# Altium schematic sheet 400_DC-DC_Part3.SchDoc: *DC-DC Convertion stage
size A4; Date: xxxxxx; DrawnBy: J.A.Oviedo; Revision: R1V1; SheetNumber: 5; SheetTotal: 5
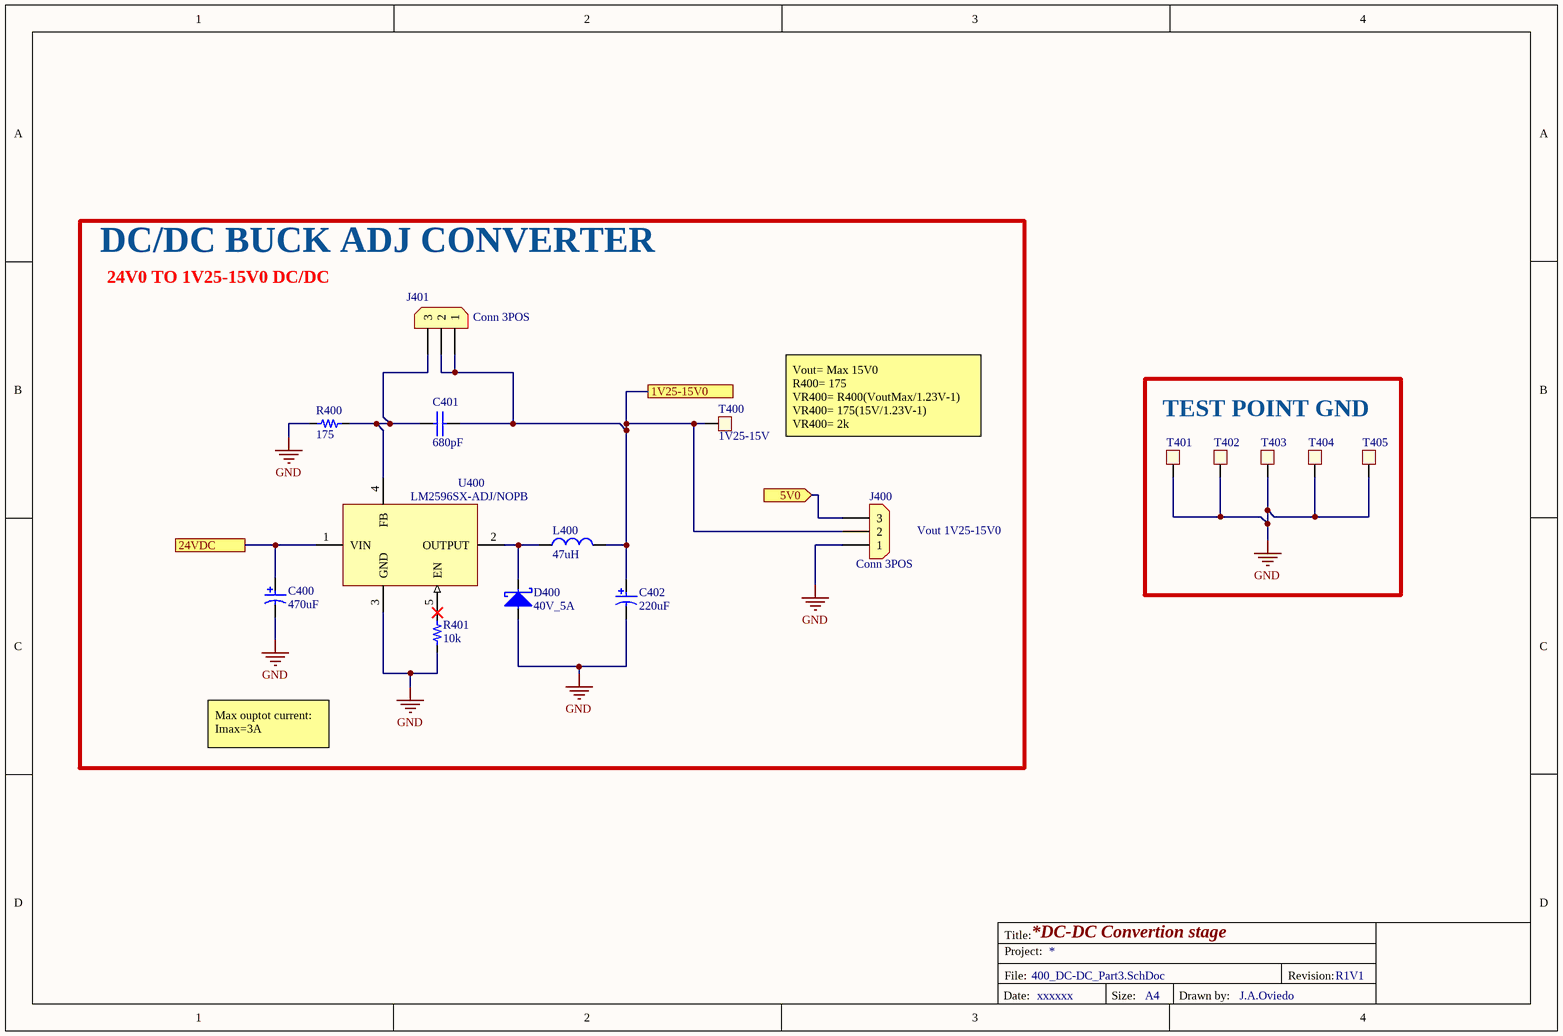
[diagram p0: 400_DC-DC_Part3.SchDoc]

## Parts
C400  value 470uF  [SMD_16*16*16]  (hidden comment: 470uF_50V)
C401  value 680pF  [0603]  (hidden comment: 680pF 50V)
C402  value 220uF  [RADIAL-CAN-SMD_Diax8mm_Hx10.2mm]  (hidden comment: 100uF 20%)
D400  40V_5A  [D_40V_5A_DO-214AC_Schottky]
J400  Conn 3POS  [CON_3x1_TH_5mm]
J401  Conn 3POS  [CON_3x1_TH_5mm]
L400  value 47uH  [L_47uH_5A_SMD_17.15x17]  (hidden comment: 47uH_5A)
R400  value 175  [Res_175_SMD-1206_2W]  (hidden comment: 175_2W)
R401  value 10k  [0603]  (hidden comment: 10k 1/10W)
T400  1V25-15V  [TP_SMD_45mil]  (no BOM)
T401  GND  [TP_SMD_45mil]  (value not drawn)  (no BOM)
T402  GND  [TP_SMD_45mil]  (value not drawn)  (no BOM)
T403  GND  [TP_SMD_45mil]  (value not drawn)  (no BOM)
T404  GND  [TP_SMD_45mil]  (value not drawn)  (no BOM)
T405  GND  [TP_SMD_45mil]  (value not drawn)  (no BOM)
U400  LM2596SX-ADJ/NOPB  [DPAK170P1435X457-6N]

## Blocks framed on the sheet
DC/DC BUCK ADJ CONVERTER: C400-C402 D400 J400 J401 L400 R400 R401 T400 U400
TEST POINT GND: T401-T405

## Ports
1V25-15V0 (see 000_Hierarchical[4C]), 5V0 (in, see 000_Hierarchical[3C], 200_DC-DC[4C]), 24VDC (see 000_Hierarchical[3D], 100_AC-DC[4B], 200_DC-DC[1A], 300_DC-DC_Part2[1A])

## Nets
GND: C400.2 C402.2 D400.2 J400.1 R400.1 R401.1 T401.1 T402.1 T403.1 T404.1 T405.1 U400.3(GND)
1V25-15V0: C401.2 C402.1 J400.2 J401.1 J401.2 L400.2 T400.1 ; port 1V25-15V0
5V0: J400.3 ; port 5V0
24VDC: C400.1 U400.1(VIN) ; port 24VDC
NetC401_1: C401.1 J401.3 R400.2 U400.4(FB)
NetD400_1: D400.1 L400.1 U400.2(OUTPUT)
NetR401_2: R401.2 U400.5(EN)

## Notes on the sheet
- 24V0 TO 1V25-15V0 DC/DC
- Vout= Max 15V0                                       R400= 175                                            VR400= R400(VoutMax/1.23V-1)
  VR400= 175(15V/1.23V-1)    VR400= 2k
- (near J400) Vout 1V25-15V0
- Max ouptot current: Imax=3A
- Title:
- Project:
- File:
- Revision:
- Date:
- Size:
- A4
- Drawn by:

## Library data of the parts
C400 = Cap_470uF_ALU_SMD-16*16*16: CAP ALUM 470UF 20% 50V SMD; Manufacturer: Vishay Beyschlag/Draloric/BC Components; Manufacturer Part Number: MAL214699108E3; Supplier 1: Digi-Key; Supplier Part Number 1: 4442PHCT-ND; Last modified by: J.A.Oviedo; Last modified date: 20261021; ComponentLink1Description: Digi-Key; ComponentLink1URL: https://www.digikey.com/en/products/detail/rubycon/50TZV100M8X10-5/3134931
C401 = Cap_680pF_0603_50V: CAP CER 680PF 50V X7R 0603; Manufacturer: KEMET; Manufacturer Part Number: C0603C681K5RAC7867; Supplier 1: Digi-Key; Supplier Part Number 1: 399-C0603C681K5RAC7867CT-ND; Last modified by: J.Jaramillo; Last modified date: 20240309; ComponentLink1Description: Digi-Key; ComponentLink1URL: https://www.digikey.com/en/products/detail/kemet/C0603C681K5RAC7867/411079
C402 = Cap_220uF_35V_ALU_SMD: CAP ALUM 220uF ±20% 35V SMD; Manufacturer: ROQANG; Manufacturer Part Number: RVT1V221M0810; Supplier 1: LCSC; Supplier Part Number 1: C72498; Reel stock: N/A; Last modified by: J.Jaramillo; Last modified date: 270326; ComponentLink1Description: LCSC; ComponentLink1URL: https://www.lcsc.com/product-detail/C72498.html?s_z=n_C72498; ComponentLink2Description: Datasheet; ComponentLink2URL: https://www.lcsc.com/product-detail/C72498.html?s_z=n_C72498
D400 = D_40V_5A_DO-214AC_Schottky: DIODE SCHOTTKY 40V 5A DO214AC; Manufacturer: MCC (Micro Commercial Components); Manufacturer Part Number: SK54A-LTP; Reel Stock: N/A; Last modified by: J.Jaramillo; Last modified date: 20240310; Supplier 1: Digi-Key; Supplier Part Number 1: SK54A-LTPMSCT-ND; ComponentLink1Description: Digi-Key; ComponentLink1URL: https://www.digikey.com/products/en?keywords=1655-1896-1-ND
J400 J401 = Con_3x1_TH_5.0mm: TERM BLK 3POS SIDE ENTRY 5MM PCB; Manufacturer: Phoenix Contact; Manufacturer Part Number: 1935174; Supplier 1: Digi-Key; Supplier Part Number 1: 277-1578-ND; Reel Stock: N/A; Last modified by: J.Jaramillo; Last modified date: 20240310; ComponentLink1Description: Digi-Key; ComponentLink1URL: https://www.digikey.com/product-detail/en/phoenix-contact/1935174/277-1578-ND/568615
L400 = L_47uH_5A_SMD_17.15x17: FIXED IND 47UH 5A 108.46 MOHM; Manufacturer: Vishay Dale; Manufacturer Part Number: IHLP6767DZER470M11; Supplier 1: Digi-Key; Supplier Part Number 1: 541-1345-1-ND; Reel Stock: N/A; Last modified date: 20261021
R400 = Res_175_SMD-1206_2W: Manufacturer: Vishay Dale Thin Film; Manufacturer Part Number: PCAN1206E1750BST5; Supplier 1: Digi-key; Supplier Part Number 1: 764-1138-1-ND; Reel Stock: N/A; Last modified by: J.A.Oviedo; Last modified date: 20261021
R401 = Res_10k_0603_1/10W: RES SMD 10K OHM 1% 1/10W 0603; Manufacturer: Samsung Electro-Mechanics; Manufacturer Part Number: RC1608F103CS; ComponentLink1URL: https://www.digikey.com/products/en?keywords=1276-3485-1-ND; Supplier 1: Digi-Key; Supplier Part Number 1: 1276-3485-1-ND; Reel Stock: N/A; Last modified by: J.Jaramillo; Last modified date: 20240310; ComponentLink1Description: Digi-key
T400-T405 = TP_SMD_45mil: Test point 45mil pad size; Last modified by: J.Jaramillo; Last modified date: 20240310
U400 = DCDC_1.25/15V_3A_TO-263-5: LM2596 SIMPLE SWITCHER 3A Step-Down Voltage Regulator; Manufacturer: TI; Manufacturer Part Number: LM2596SX-ADJ/NOPB; Supplier 1: LCSC; Supplier Part Number 1: C29781; Reel Stock: N/A; Last modified by: J.A.Oviedo; Last modified date: 20261020; ComponentLink1Description: LCSC; ComponentLink1URL: https://www.lcsc.com/es/product-detail/C29781.html?s_z=n_q_t_LM2596; ComponentLink2Description: DATASHEET; ComponentLink2URL: https://www.lcsc.com/datasheet/C29781.pdf